# Altium schematic sheet K601-6252 VER1.1双模带屏.SchDoc
size A3; SheetNumber: 1; SheetTotal: 1
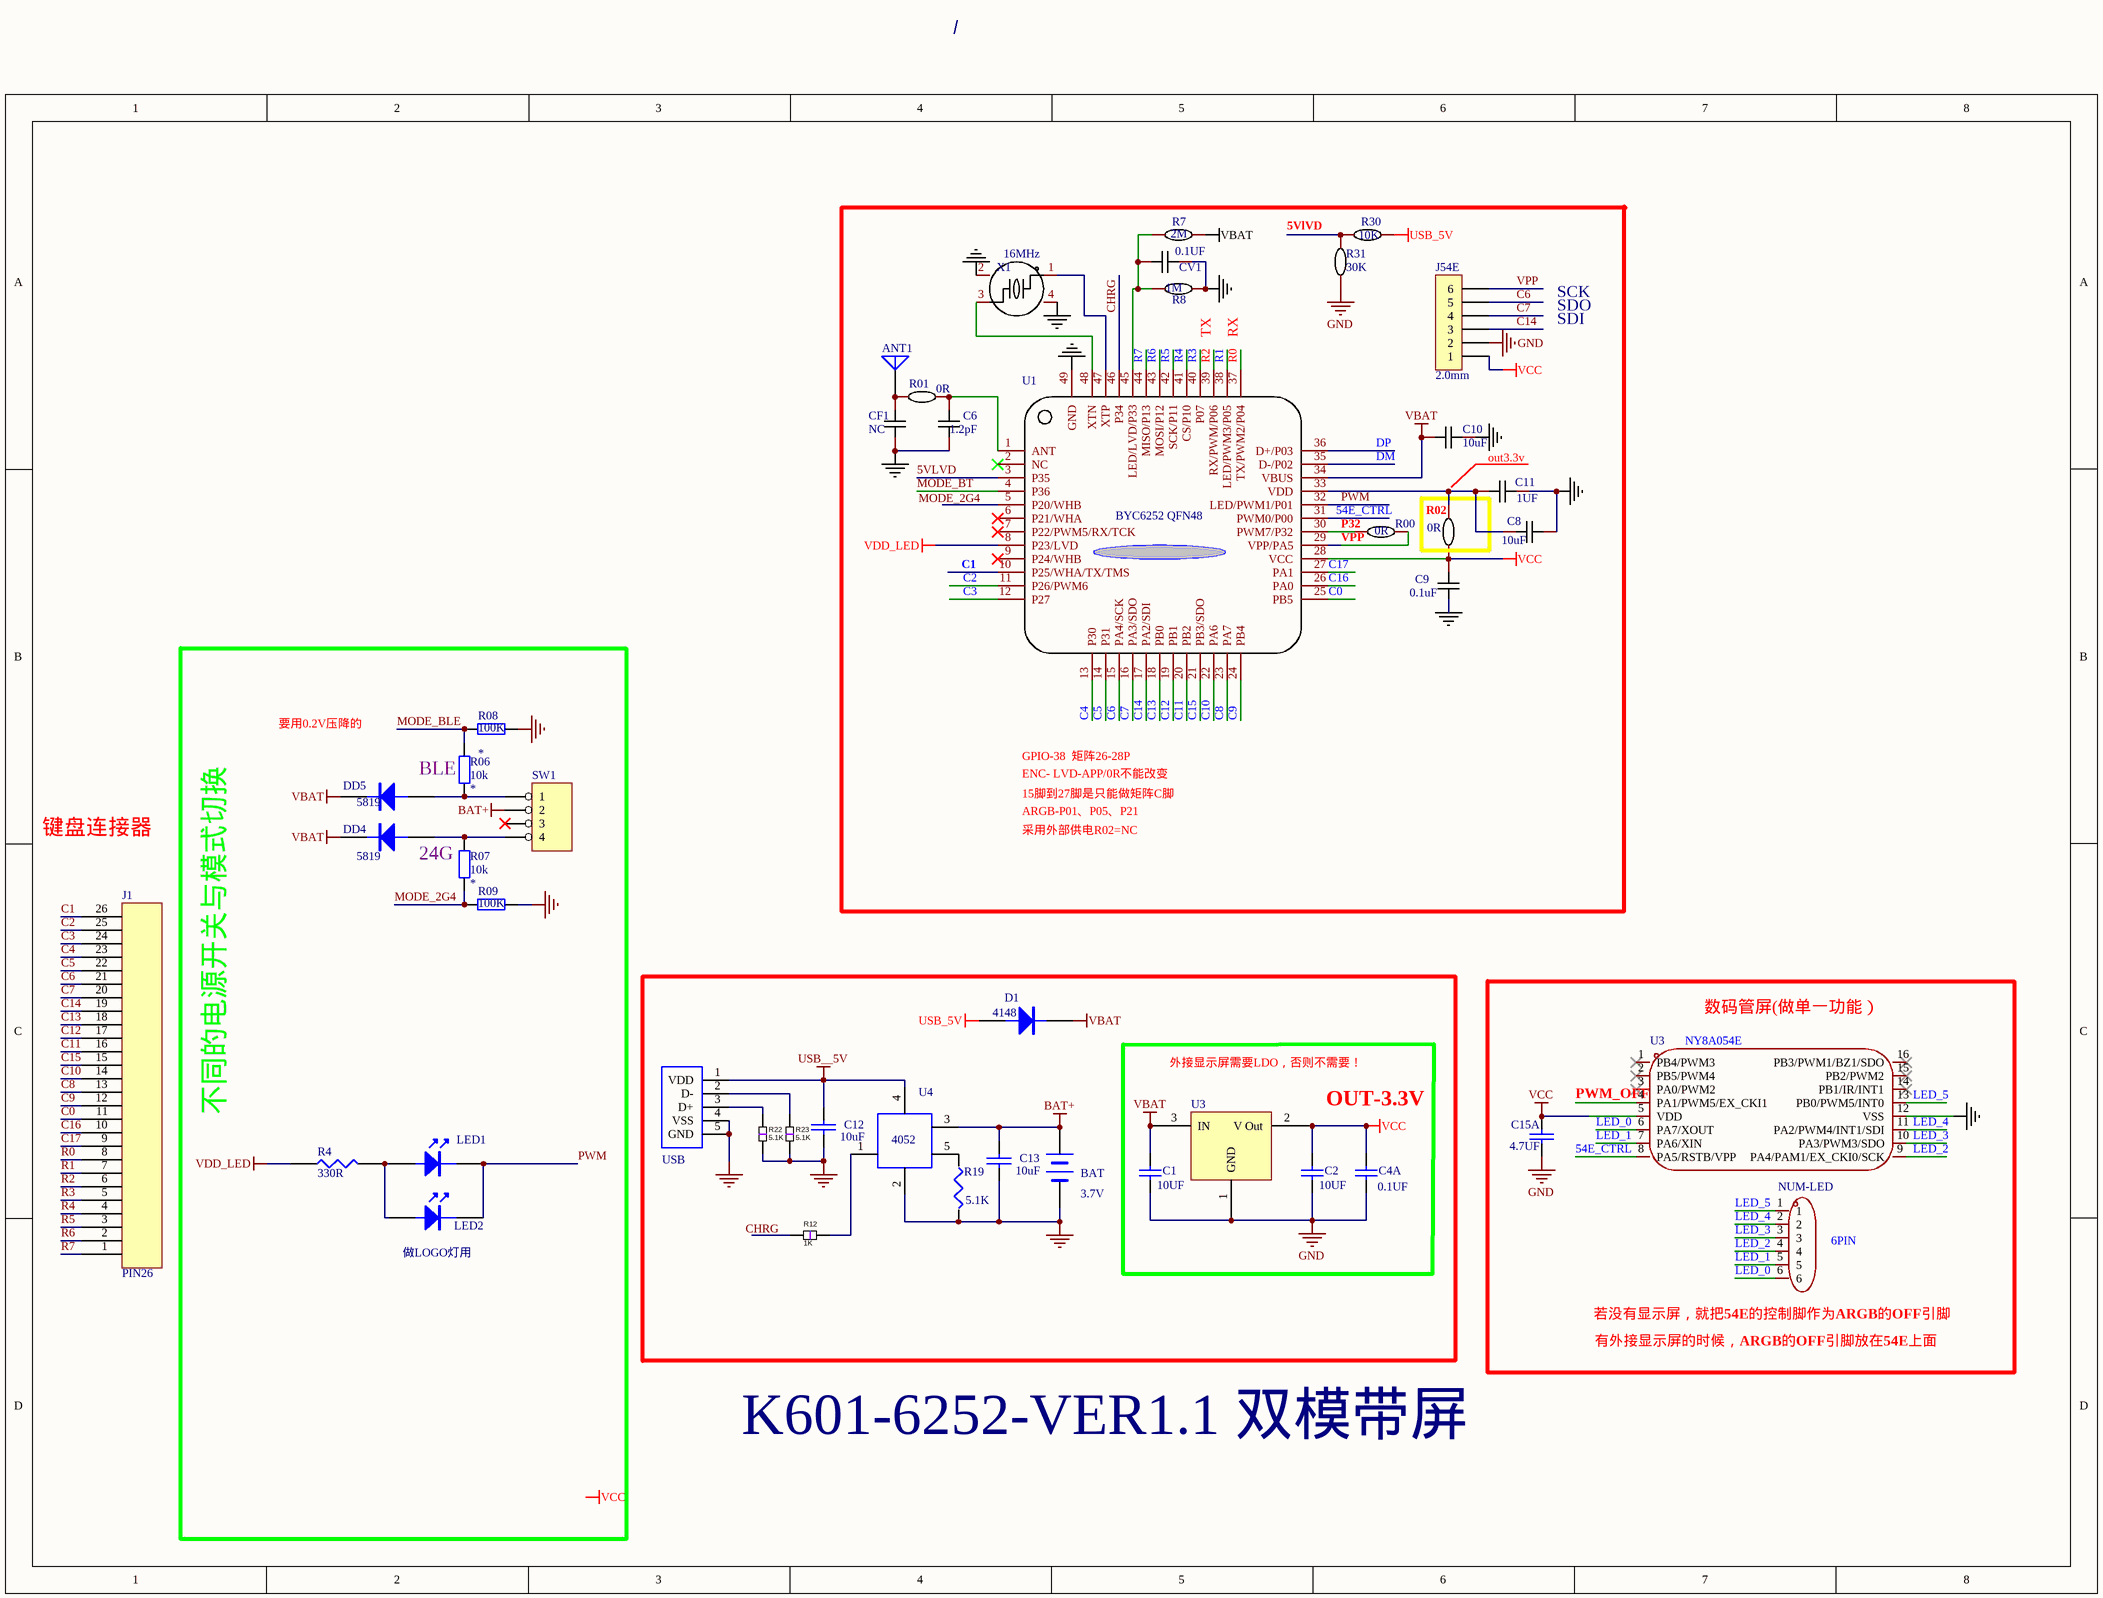
[diagram p0: K601-6252 VER1.1双模带屏.SchDoc]

## Parts
(Parts that share a designator on the sheet are numbered #1, #2 ... from top to bottom, then left to right.)
?  USB  [MICRO USB]
ANT1  A1  [ANT]  (value not drawn)
BAT  3.7V  [CON2-2.0]
C1  value 10UF  [0603C]  (hidden comment: 4.7UF)
C2  10UF  [0603C]
C4A  0.1UF  [0402c]
C6  1.2pF  [0402c]
C8  10uF  [0603C]
C9  0.1uF  [0402C]
C10  10uF  [0603C]
C11  1UF  [0402c]
C12  10uF  [0603CC]
C13  10uF  [0603CC]
C15A  4.7UF  [0603C]
CF1  Name: NC  [0402c]  (hidden comment: 1.2pF)
CV1  0.1UF  [0402c]
D1  4148  [1206D]
DD4  5819  [3D-CD-A(3216)1206]
DD5  5819  [3D-CD-A(3216)1206]
J1  PIN26  [CON26]
J54E  2.0mm  [CON6-2.0]
LED1  (no value)  [0805D]
LED2  (no value)  [0805D]
NUM-LED  6PIN  [NLED2]
R00  0R  [0402R]
R01  0R  [0402R]
R02  0R  [0402R]
R4  330R
R06  10k  [0603R]
R7  2M  [3D-0603R]
R07  10k  [0603R]
R8  1M  [3D-0603R]
R08  100K  [0603R]
R09  100K  [0603R]
R12  1K  [R0603]
R19  PartField5: 5.1K  [0603RR]  (hidden comment: RES1_2)
R22  5.1K  [R0603]
R23  5.1K  [R0603]
R30  10K  [3D-0603R]
R31  30K  [3D-0603R]
SW1  (no value)  [SWP1]
U1  BYC6252 QFN48  [QFN48-6*6]
U3#1  NY8A054E  [SOP16A]
U3#2  6206 3V  [3D-SOT23]  (value not drawn)
U4  4052  [SOT23-5]
X1  16MHz  [3D-3225-4P]

## Blocks framed on the sheet
不同的电源开关与模式切换: DD4 DD5 LED1 LED2 R4 R06 R07 R08 R09 SW1
数码管屏(做单一功能）: C15A NUM-LED U3#1
OUT-3.3V: C1 C2 C4A U3#2

## Nets
BAT+: BAT.1(+) C13.1 SW1.2 U4.3
GND: ?.4(VSS) ?.5(GND) C1.1 C2.1 C4A.1 C6.1 C8.2 C9.2 C10.2 C11.2 C12.2 C15A.1 CF1.1 CV1.2 J54E.2 R8.1 R08.2 R09.1 R22.1 R23.1 R31.1 U1.49(GND) U3#2.1(GND) X1.2(GND) X1.4(GND)
NetBAT_2: BAT.2(-) C13.2 R19.1 U3#1.12(VSS) U4.2
USB_5V: D1.1(A) R30.2
USB__5V: ?.1(VDD) C12.1 U4.4
VBAT: C1.2 C10.1 D1.2(K) DD4.2(K) DD5.2(K) R7.2 U1.34(VBUS) U3#2.3(IN)
VCC: C2.2 C4A.2 C9.1 C15A.2 J54E.1 R02.1 U1.28(VCC) U3#1.5(VDD) U3#2.2(V_Out)
VDD_LED: R4.1 U1.8(P23/LVD)
5VLVD: U1.3(P35)
54E_CTRL: U1.31(PWM0/P00) U3#1.8(PA5/RSTB/VPP)
C0: J1.11(C10) U1.25(PB5)
C1: J1.26(R7) U1.10(P25/WHA/TX/TMS)
C2: J1.25(R6) U1.11(P26/PWM6)
C3: J1.24(R5) U1.12(P27)
C4: J1.23(R3) U1.13(P30)
C5: J1.22(R3) U1.14(P31)
C6: J1.21(R2) J54E.5 U1.15(PA4/SCK)
C7: J1.20(R1) J54E.4 U1.16(PA3/SDO)
C8: J1.13(C12) U1.23(PA7)
C9: J1.12(C11) U1.24(PB4)
C10: J1.14(C13) U1.22(PA6)
C11: J1.16(C15) U1.20(PB2)
C12: J1.17(C16) U1.19(PB1)
C13: J1.18(C17) U1.18(PB0)
C14: J1.19(R0) J54E.3 U1.17(PA2/SDI)
C15: J1.15(C14) U1.21(PB3/SDO)
C16: J1.10(C9) U1.26(PA0)
C17: J1.9(C8) U1.27(PA1)
CHRG: U1.46(P34)
DM: U1.35(D-/P02)
DP: U1.36(D+/P03)
LED_0: NUM-LED.6 U3#1.6(PA7/XOUT)
LED_1: NUM-LED.5 U3#1.7(PA6/XIN)
LED_2: NUM-LED.4 U3#1.9(PA4/PAM1/EX_CKI0/SCK)
LED_3: NUM-LED.3 U3#1.10(PA3/PWM3/SDO)
LED_4: NUM-LED.2 U3#1.11(PA2/PWM4/INT1/SDI)
LED_5: NUM-LED.1 U3#1.13(PB0/PWM5/INT0)
MODE_2G4: R07.2 R09.2
MODE_BLE: R06.1 R08.1
MODE_BT: U1.4(P36)
P32: R00.1 U1.30(PWM7/P32)
PWM: LED1.K LED2.K U1.32(LED/PWM1/P01)
PWM_OFF: U3#1.4(PA1/PWM5/EX_CKI1)
R0: J1.8(C7) U1.37(TX/PWM2/P04)
R1: J1.7(C6) U1.38(LED/PWM3/P05)
R2: J1.6(C5) U1.39(RX/PWM/P06)
R3: J1.5(C4) U1.40(P07)
R4: J1.4(C3) U1.41(CS/P10)
R5: J1.3(C2) U1.42(SCK/P11)
R6: J1.2(C1) U1.43(MOSI/P12)
R7: J1.1(C0) U1.44(MISO/P13)
VPP: J54E.6 R00.2 U1.29(VPP/PA5)
Net?_2: ?.2(D-) R23.2
Net?_3: ?.3(D+) R22.2
NetANT1_1: ANT1.1 CF1.2 R01.2
NetC6_2: C6.2 R01.1 U1.1(ANT)
NetC8_1: C8.1 C11.1 R02.2 U1.33(VDD)
NetCV1_1: CV1.1 R7.1 R8.2 U1.45(LED/LVD/P33)
NetDD4_1: DD4.1(A) R07.1 SW1.4
NetDD5_1: DD5.1(A) R06.2 SW1.1
NetLED1_A: LED1.A LED2.A R4.2
NetR12_1: R12.1 U4.1
NetR19_2: R19.2 U4.5
NetR30_1: R30.1 R31.2
NetU1_47: U1.47(XTP) X1.1
NetU1_48: U1.48(XTN) X1.3

Not connected (* = marked no-connect by the designer): R12 2; SW1 3*; U1 2(NC)* 5(P20/WHB) 6(P21/WHA)* 7(P22/PWM5/RX/TCK)* 9(P24/WHB)*; U3#1 1(PB4/PWM3)* 2(PB5/PWM4)* 3(PA0/PWM2)* 14(PB1/IR/INT1)* 15(PB2/PWM2)* 16(PB3/PWM1/BZ1/SDO)*

## Notes on the sheet
- 5VlVD
- (near R8) TX
- RX
- SCK
- SDO
- SDI
- out3.3v
- 要用0.2V压降的
- BLE
- ENC- LVD-APP/0R不能改变
- 15脚到27脚是只能做矩阵C脚
- GPIO-38  矩阵26-28P
- 键盘连接器
- 24G
- ARGB-P01、P05、P21
- 采用外部供电R02=NC
- 外接显示屏需要LDO，否则不需要！
- (near LED2) 做LOGO灯用
- (near NUM-LED) 若没有显示屏，就把54E的控制脚作为ARGB的OFF引脚
- 有外接显示屏的时候，ARGB的OFF引脚放在54E上面
- K601-6252-VER1.1 双模带屏
- Labels drawn without touching a wire or pin: CHRG, MODE_2G4, VCC

## Library data of the parts
ANT1 = ANT: Generic Antenna
BAT = BATTERY
C1 C2 C4A = Cap: Capacitor; Published: 8-Jun-2000; LatestRevisionDate: 17-Jul-2002; LatestRevisionNote: Re-released for DXP Platform.; PackageReference: RAD-0.3; Publisher: Altium Limited; PackageDescription: Radial Cap, Thru-Hole; 2 Leads; 0.3 in Pin Spacing
  C2: Value: 10UF
  C4A: Value: 0.1UF
C6 C8-C10 CF1 = CAP_0603: Symbol: CapAcitance; Convert to PCB: yes; Device: CAP_0603; Add into BOM: yes; Supplier Footprint: 0603
  C6: Name: 1.2pF; Value: 1.2pF
  C8 C10: Name: 10uF; Value: 10uF
  C9: Name: 0.1uF; Value: 0.1uF
  CF1: Value: 1.2pF
C11 CV1 = CAP_0603: Symbol: CapAcitance; Convert to PCB: yes; Value: 10uF; Device: CAP_0603; Add into BOM: yes; Supplier Footprint: 0603
  C11: Name: 1UF
C12 C13 = CAP1: Capacitor
C15A = CAP: Capacitor
D1 DD4 DD5 = DIODE
J1 = ANTENNA: Generic Antenna
J54E = CON6: Connector
LED1 LED2 = LED
NUM-LED = PZ254V-11-06P: Manufacturer: XFCN(兴飞); Add into BOM: yes; Pin Structure: 1x6P; Pitch: 2.54mm; Circluar Pins/Square Pins: 方针; Symbol: PZ254V-11-06P; Device: PZ254V-11-06P; LCSC Part Name: 间距:2.54mm 1x6P 直插 方针; Supplier Part: C492405; Manufacturer Part: PZ254V-11-06P; Supplier Footprint: 插件,P=2.54mm; JLCPCB Part Class: Extended Part; Datasheet: https://atta.szlcsc.com/upload/public/pdf/source/20200309/C492405_597F1930F5B55CC3C7FD95458F1C3977.pdf; Supplier: LCSC; Convert to PCB: yes; Row Spacing: -; Mounting Type: 直插; Number of Rows: 单排; Number of Pins: 6P; Current Rating (Max): -; Voltage Rating (Max): -; Length of Mating Pin: 6mm; Insulation Height: 2.5mm; Length of End Connection Pin: 3mm; Contact Material: 黄铜; Contact Plating: -; Operating Temperature Range: -40℃~+105℃; Color: 黑色
R00 R02 R7 R8 = Res_0603: Symbol: 电阻; Convert to PCB: yes; Device: Res_0603; Add into BOM: yes; Supplier Footprint: 0603
  R00 R02: Value: 0R
  R7: Name: 2M; Value: 2M
  R8: Name: 1M; Value: 1M
R01 R30 R31 = Res_0603: Symbol: 电阻; Convert to PCB: yes; Value: 2M; Device: Res_0603; Add into BOM: yes; Supplier Footprint: 0603
R4 = RES1
R06 R07 R08 R09 = Res2: Resistor; Published: *; LatestRevisionDate: *; LatestRevisionNote: *; PackageReference: *; Publisher: *
  R06 R07 R08: Value: *
R12 R22 R23 = RES
R19 = RES1_2: PartField1: Model$; VALUE: 10K; PCB DECAL: R-0402; PartField2: R; PartField4: IPC SM-782 STD.; PartField7: R0402
SW1 = 4 HEADER: 4 Pin Header
U1 = BYC6625 QFN48: Add into BOM: yes; Symbol: BYC6625 QFN48; Device: BYC6625 QFN48; Convert to PCB: yes
U3#1 = NY8A054E_C5143691: Manufacturer: 九齐; Add into BOM: yes; Symbol: NY8A054E_C5143691; Device: NY8A054E_C5143691; LCSC Part Name: NY8A054E; Supplier Part: C5143691; Manufacturer Part: NY8A054E; Supplier Footprint: SOP-16; JLCPCB Part Class: Extended Part; Datasheet: https://atta.szlcsc.com/upload/public/pdf/source/20220901/9859F0BC82D614E1FA05D663ED00CF5E.pdf; Supplier: LCSC; Convert to PCB: yes
U3#2 = HX6206
U4 = SGM4054
X1 = XL7EL89COI-111YLC-16M: Manufacturer: YXC(扬兴晶振); Add into BOM: yes; Crystal Type: 贴片晶振; Normal temperature Frequency Tolerance: ±10ppm; Name: 16MHz; Symbol: XL7EL89COI-111YLC-16M; Device: XL7EL89COI-111YLC-16M; LCSC Part Name: 16MHz ±10ppm 12pF; Supplier Part: C2965579; Manufacturer Part: XL7EL89COI-111YLC-16M; Supplier Footprint: SMD2016-4P; JLCPCB Part Class: Extended Part; Datasheet: https://atta.szlcsc.com/upload/public/pdf/source/20240329/C26C9A15A73CBCFBF373B30A8E126750.pdf; Supplier: LCSC; Convert to PCB: yes; Value: 16MHz